# Altium schematic sheet JigInterface.SchDoc
size Letter; SheetNumber: 7; SheetTotal: 15
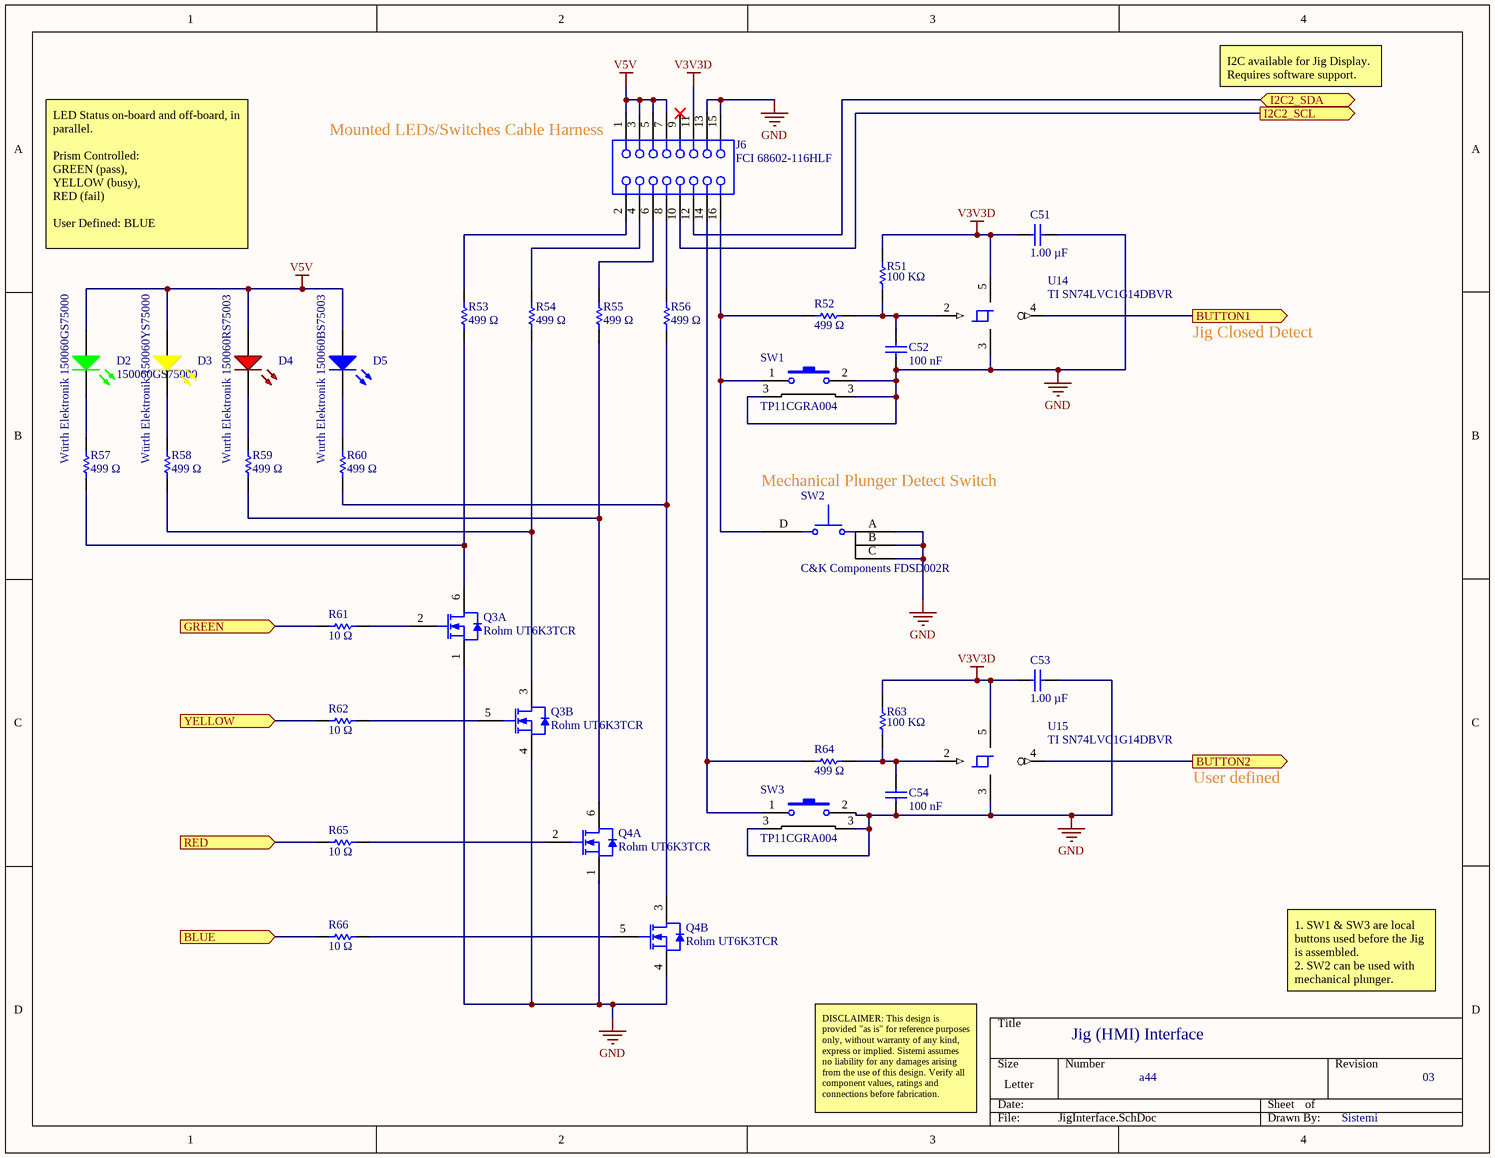
[diagram p0: JigInterface.SchDoc]

## Parts
C51  Capacitance: 1.00 µF  [CAPC1608X90X35NL15T15]  (hidden comment: Samsung CL10B105KA8NNNC)
C52  Capacitance: 100 nF  [CAPC1005X56X25NL10T15]  (hidden comment: Samsung CL05B104KO5NNNC)
C53  Capacitance: 1.00 µF  [CAPC1608X90X35NL15T15]  (hidden comment: Samsung CL10B105KA8NNNC)
C54  Capacitance: 100 nF  [CAPC1005X56X25NL10T15]  (hidden comment: Samsung CL05B104KO5NNNC)
D2  Würth Elektronik 150060GS75000  Manufacturer Part Number: 150060GS75000  [PCB-5fu3j7c0qqekthrt71i6-1]
D3  Würth Elektronik 150060YS75000  [PCB-zc2vv3u4p0giaiwimi3e-1]
D4  Wurth Elektronik 150060RS75003  [Wurth Elektronik 150060RS75003-Footprint-1]
D5  Wurth Elektronik 150060BS75003  [0603D_C]
J6  FCI 68602-116HLF  [HEADER8X2]
Q3  Rohm UT6K3TCR  [DFN2020-8D]  (parts A,B of 2)
Q4  Rohm UT6K3TCR  [DFN2020-8D]  (parts A,B of 2)
R51  Resistance: 100 KΩ  [RESC1005X40X25NL05T05]  (hidden comment: 100 KΩ,±1%,0402)
R52  Resistance: 499 Ω  [RESC1608X55X30ML15T15]  (hidden comment: Generic RES 0603)
R53  Resistance: 499 Ω  [RESC1608X55X30ML15T15]  (hidden comment: Generic RES 0603)
R54  Resistance: 499 Ω  [RESC1608X55X30ML15T15]  (hidden comment: Generic RES 0603)
R55  Resistance: 499 Ω  [RESC1608X55X30ML15T15]  (hidden comment: Generic RES 0603)
R56  Resistance: 499 Ω  [RESC1608X55X30ML15T15]  (hidden comment: Generic RES 0603)
R57  Resistance: 499 Ω  [RESC1608X55X30ML15T15]  (hidden comment: Generic RES 0603)
R58  Resistance: 499 Ω  [RESC1608X55X30ML15T15]  (hidden comment: Generic RES 0603)
R59  Resistance: 499 Ω  [RESC1608X55X30ML15T15]  (hidden comment: Generic RES 0603)
R60  Resistance: 499 Ω  [RESC1608X55X30ML15T15]  (hidden comment: Generic RES 0603)
R61  Resistance: 10 Ω  [RESC1005X40X25NL05T05]  (hidden comment: 10 Ω,±1%,0402)
R62  Resistance: 10 Ω  [RESC1005X40X25NL05T05]  (hidden comment: 10 Ω,±1%,0402)
R63  Resistance: 100 KΩ  [RESC1005X40X25NL05T05]  (hidden comment: 100 KΩ,±1%,0402)
R64  Resistance: 499 Ω  [RESC1608X55X30ML15T15]  (hidden comment: Generic RES 0603)
R65  Resistance: 10 Ω  [RESC1005X40X25NL05T05]  (hidden comment: 10 Ω,±1%,0402)
R66  Resistance: 10 Ω  [RESC1005X40X25NL05T05]  (hidden comment: 10 Ω,±1%,0402)
SW1  TP11CGRA004  [PCB-kxc5zoxy62rh6gxl0cji-1]
SW2  C&K Components FDSD002R  [FDSD002r]
SW3  TP11CGRA004  [PCB-kxc5zoxy62rh6gxl0cji-1]
U14  TI SN74LVC1G14DBVR  [TI-DBV5_M]
U15  TI SN74LVC1G14DBVR  [TI-DBV5_M]

## Ports
BLUE (in), BUTTON1 (out), BUTTON2 (out), GREEN (in), I2C2_SCL (out), I2C2_SDA (bidir), RED (in), YELLOW (in)

## Nets
3: Q3.8(D) Q4.8(D)
6: Q3.7(D) Q4.7(D)
GND: C51.1 C52.2 C53.1 C54.2 J6.13 J6.15 Q3.1(S) Q3.4(S) Q4.1(S) Q4.4(S) SW1.2 SW1.3 SW2.A SW2.B SW2.C SW3.2 SW3.3 U14.3 U15.3
V3V3D: C51.2 C53.2 J6.11 R51.2 R63.2 U14.5 U15.5
V5V: D2.2(A) D3.2(A) D4.1(A) D5.1(A) J6.1 J6.3 J6.5 J6.7
BLUE: R66.2 ; port BLUE
BUTTON1: U14.4(Y) ; port BUTTON1
BUTTON2: U15.4(Y) ; port BUTTON2
GREEN: R61.2 ; port GREEN
I2C2_SCL: J6.10 ; port I2C2_SCL
I2C2_SDA: J6.12 ; port I2C2_SDA
RED: R65.2 ; port RED
YELLOW: R62.2 ; port YELLOW
NetC52_1: C52.1 R51.1 R52.1 U14.2(A)
NetC54_1: C54.1 R63.1 R64.1 U15.2(A)
NetD2_1: D2.1(K) R57.2
NetD3_1: D3.1(K) R58.2
NetD4_2: D4.2(K) R59.2
NetD5_2: D5.2(K) R60.2
NetJ6_2: J6.2 R53.2
NetJ6_4: J6.4 R54.2
NetJ6_6: J6.6 R55.2
NetJ6_8: J6.8 R56.2
NetJ6_14: J6.14 R64.2 SW3.1
NetJ6_16: J6.16 R52.2 SW1.1 SW2.D
NetQ3_2: Q3.2(G) R61.1
NetQ3_3: Q3.3(D) R54.1 R58.1
NetQ3_5: Q3.5(G) R62.1
NetQ3_6: Q3.6(D) R53.1 R57.1
NetQ4_2: Q4.2(G) R65.1
NetQ4_3: Q4.3(D) R56.1 R60.1
NetQ4_5: Q4.5(G) R66.1
NetQ4_6: Q4.6(D) R55.1 R59.1

Not connected (* = marked no-connect by the designer): J6 9*

## Notes on the sheet
- I2C available for Jig Display.  Requires software support.
- (near J6) Mounted LEDs/Switches Cable Harness
- LED Status on-board and off-board, in parallel.
  Prism Controlled:
  GREEN (pass),
  YELLOW (busy),
  RED (fail)
  User Defined: BLUE
- Jig Closed Detect
- (near SW2) Mechanical Plunger Detect Switch
- User defined
- Jig (HMI) Interface
- 1. SW1 & SW3 are local buttons used before the Jig is assembled.
  2. SW2 can be used with mechanical plunger.
- DISCLAIMER: This design is provided "as is" for reference purposes only, without warranty of any kind, express or implied. Sistemi assumes no liability for any damages arising from the use of this design. Verify all component values, ratings and connections before fabrication.
- a44
- 03
- Sistemi

## Library data of the parts
C51 C53 = CMP-7473528-5: CL Series 0603 1 uF 25 V ±10 % X7R Surface Mount Multilayer Ceramic Capacitor; Manufacturer Part Number: UMK107AB7105KA-T; Lead-Free Status: Lead Free; Capacitance Tolerance: ±10%; Voltage Rating (DC): 25.0 V; RoHS: Compliant; Mounting Style: Surface Mount; Footprint: PCB-0002-00062-3; Octopart URL: http://octopart.com/cl10b105ka8nnnc-samsung-19831597; Case/Package: 0603; OctopartID: ce7a065e703111bd; Dielectric Characteristic: X7R
C52 C54 = CMP-bf2276a55d9a60e5-19: Ceramic capacitor SMD-0402 100nF /16V X7R# K +-10%, Samsung, RoHS; Dielectric Characteristic: X7R; Lead-Free Status: Lead Free; Voltage Rating (DC): 16.0 V; Capacitance Tolerance: ±10%; Mounting Style: Surface Mount; Case/Package: 0402; OctopartID: 0755ced2c795d892; Footprint: PCB-0002-00476-3; Octopart URL: https://octopart.com/cl05b104ko5nnnc-samsung-9299366; RoHS: Compliant; Manufacturer Part Number: CL05B104KO5NNNC
D2 = CMP-12518857-12: Led, Green, 520 Nm, 3.2 V, 30 Ma, 430 Mcd Rohs Compliant: Yes; Footprint: PCC-0029-00260-1
D3 = CMP-12518863-13: Led, Yellow, 590 Nm, 2 V, 30 Ma, 120 Mcd Rohs Compliant: Yes; Forward Voltage: 2.00 V; Viewing Angle: 140 °; Luminous Intensity: 120 mcd; RoHS: Compliant; Footprint: PCB-rxfjlzgnb1funqct5a9u-1; OctopartID: fe0f36c1264421c8; REACH SVHC Compliance: No SVHC; Manufacturer Part Number: 150060YS75000; Octopart URL: https://octopart.com/150060ys75000-w%C3%BCrth+elektronik-29687085; Case/Package: 0603; Color: Yellow; Packaging: Tape & Reel (TR); Mounting Style: Surface Mount
D4 = CMP-1f4ad1c426c2c08d-4: SMT Mono-color Chip Led Watercle; OctopartID: 1f4ad1c426c2c08d; Manufacturer Part Number: 150060RS75003; Octopart Url: https://octopart.com/150060rs75003-wurth+elektronik-126098670
D5 = CMP-3fa7f129062de060-1: SMT Mono-Color Chip LED Waterclear Advance; Color: Blue; Voltage: 3.2V; Forward Current: 20mA; Octopart Url: https://octopart.com/150060bs75003-wurth+elektronik-126098668; Manufacturer Part Number: 150060BS75003; OctopartID: 3fa7f129062de060
J6 = CMP-429f8bf83f2c9d58-5: Conn Unshrouded Header HDR 16 POS 2.54mm Solder ST Thru-Hole Poly Bag; Number of Contacts: 16; Gender: Male; Octopart URL: http://octopart.com/68602-116hlf-fci-7166165; Pin Pitch: 2.54 mm; Packaging: Bulk; Contact Plating: Gold; Footprint: PCB-8dkjn6b77nx2tsqv24pv-3; OctopartID: 429f8bf83f2c9d58; Manufacturer Part Number: 68602-116HLF; Contact Material: Phosphor Bronze; RoHS: Compliant; Number of Rows: 2; Mounting Style: Through Hole
Q3 Q4 = CMP-7da2b0d499b7a265-2: On a Reel of 3000, Dual N-Channel MOSFET, 5.5 A, 30 V, 8-Pin DFN ROHM UT6K3TCR; Polarity: Dual N-Channel; Footprint: PCB-qj1nrqbgj5udp5r3frdj-1; RoHS: Compliant; OctopartID: 7da2b0d499b7a265; Manufacturer Part Number: UT6K3TCR; Operating Temperature: 150 °C (max); Octopart URL: https://octopart.com/ut6k3tcr-rohm-75284851
R51 R63 = CMP-3902036-3: Generic RES 0402, =Resistance+','+Tolerance+','+Case; Manufacturer Part Number: RT0402FRE07100KL; Lead-Free Status: Lead Free; Voltage: 50.0 V; Power: 0.063 W; Mounting Style: Surface Mount; RoHS: Compliant; Number of Pins: 2; Tolerance: ±1%; Octopart Url: TBD; Case: 0402; OctopartID: 26dced8948c2f91b
R52-R60 R64 = CMP-0800c38b3cf2d7c7-3: Generic RES 0603, =Resistance+','+Tolerance+','+Case; Manufacturer Part Number: MCT06030C4990FP500; Case/Package (SI): 1608; Lead-Free Status: Lead Free; Power Rating: 63.0 mW; Voltage: 50V; ELV Compliant: Compliant; Tolerance: ±1%; Temperature Coefficient: -50.0 ppm/°C to 50.0 ppm/°C; Octopart URL: TBD; Number of Pins: 2; Mounting Style: Surface Mount; Packaging: Tape & Reel (TR); Lifecycle Status: Active; RoHS: Compliant; Case: 0603; Operating Temperature: -55.0 °C to 125 °C; REACH SVHC Compliance: No SVHC; Footprint: PCB-0002-00066-3; OctopartID: a8e96364fc37772e
R61 R62 R65 R66 = CMP-3902036-3: Generic RES 0402, =Resistance+','+Tolerance+','+Case; Manufacturer Part Number: RT0402FRE0710RL; Lead-Free Status: Lead Free; Voltage: 50.0 V; Power: 0.063 W; Mounting Style: Surface Mount; RoHS: Compliant; Number of Pins: 2; Tolerance: ±1%; Octopart Url: TBD; Case: 0402; OctopartID: 26dced8948c2f91b
SW1 SW3 = CMP-1ee7d7ec700bc120-1: Switch, Pushbutton, Thru-Hole Mount, SPST, PC Mount, 1000 V (RMS) (Min.); Contact Resistance: 20.0 mΩ (max); ELV Compliant: Non-Compliant; Lead-Free Status: Contains Lead; Size-Width: 5.08 mm; Octopart URL: https://octopart.com/tp11cgra0-te+connectivity+%2F+alcoswitch-84874; Lifecycle Status: Active; Contacts Type: SPST; OctopartID: 1ee7d7ec700bc120; RoHS: Non-Compliant; Packaging: Bulk; Orientation: Right Angle; Size-Length: 8.13 mm; Manufacturer Part Number: TP11CGRA004; Contact Plating: Gold over Nickel; Operating Temperature: 65.0 °C (max); Contact Material: Copper Alloy; Mounting Style: Through Hole
SW2 = CMP-8f1943a01c3050de-6: Switch Detector Side Actuated OFF-MOM 10mA 5VDC 0.39N SPST-NO Flat Terminal Surface Mount T/R; Lead-Free Status: Lead Free; RoHS: Compliant; Octopart URL: https://octopart.com/fdsd002r-c%26k+components-95663695; Footprint: PCB-eidm0z1z6we3mnuhu73s-3; Manufacturer Part Number: FDSD002R; OctopartID: 8f1943a01c3050de
U14 U15 = CMP-19354130-5: IC SCHMITT TRIG INV SOT-23-5; Lead-Free Status: Lead Free; Propagation Delay Max (tpd): 5e-09 s; Output Current: 0.032 A; Number of Bits: 1; Supply Voltage (DC): 5.0 V; Output Current Drive: -0.001 A; REACH SVHC Compliance: No SVHC; OctopartID: 3234fb390160edf3; RoHS: Compliant; Manufacturer Part Number: SN74LVC1G14DBVR; Footprint: PCC-0151-00548-1; Octopart Url: https://octopart.com/sn74lvc1g14dbvr-texas+instruments-464434; Number of Pins: 5; Mounting Style: Surface Mount; Number of Circuits: 1; Number of Gates: 1; Lifecycle Status: Active; Case/Package: SOT-23